# Altium schematic sheet [01] - CAPA.SchDoc
size A3; DocumentNumber: 2; SheetNumber: 2; SheetTotal: 6
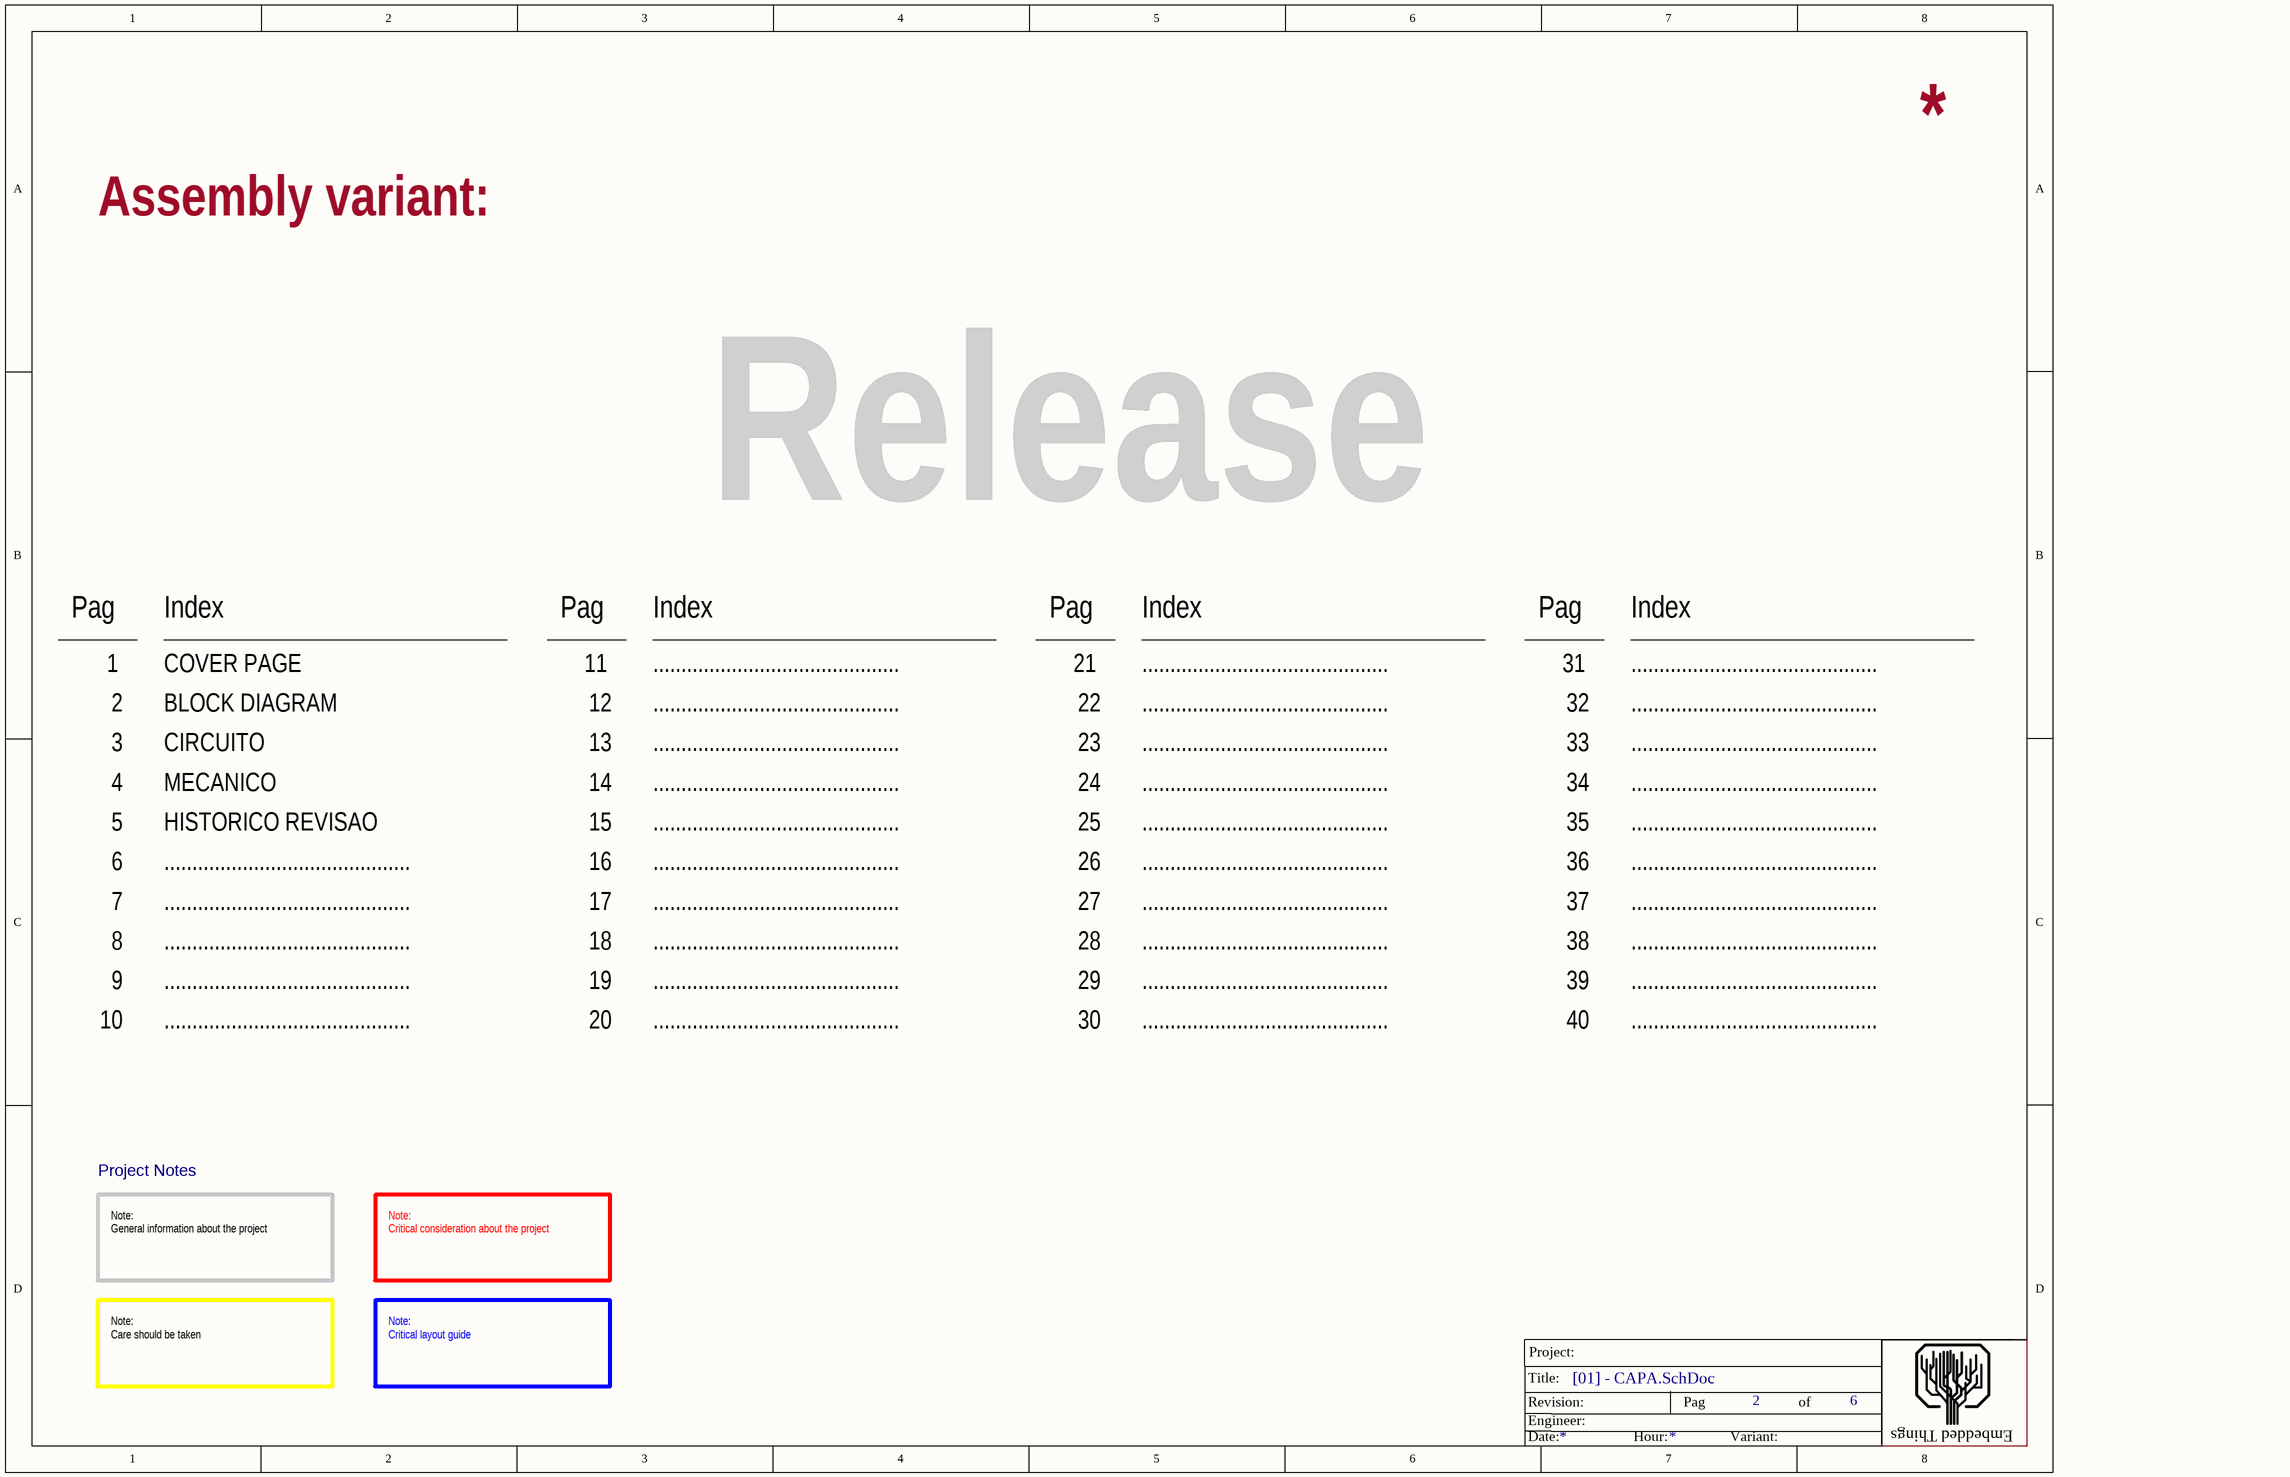
[diagram p0: [01] - CAPA.SchDoc]

## Notes on the sheet
- Assembly variant:
- Release
- Pag
- Index
- 1
- COVER PAGE
- 11
- ............................................
- 21
- 31
- 2
- 3
- BLOCK DIAGRAM
- CIRCUITO
- 12
- 13
- 22
- 23
- 32
- 33
- 4
- 5
- MECANICO
- HISTORICO REVISAO
- 14
- 15
- 24
- 25
- 34
- 35
- 6
- 16
- 26
- 36
- 7
- 8
- 17
- 18
- 27
- 28
- 37
- 38
- 9
- 10
- 19
- 20
- 29
- 30
- 39
- 40
- Project Notes
- Note:
  General information about the project
- Note:
  Critical consideration about the project
- Note:
  Care should be taken
- Note:
  Critical layout guide
- Project:
- Revision:
- Engineer:
- Title:
- of
- Embedded Things
- Date:
- Hour:
- Variant: